# Altium schematic sheet MCU.SchDoc: MCU
size A3; Revision: V2.0; SheetNumber: 3; SheetTotal: 7; Project: PY32F403v1xT_START
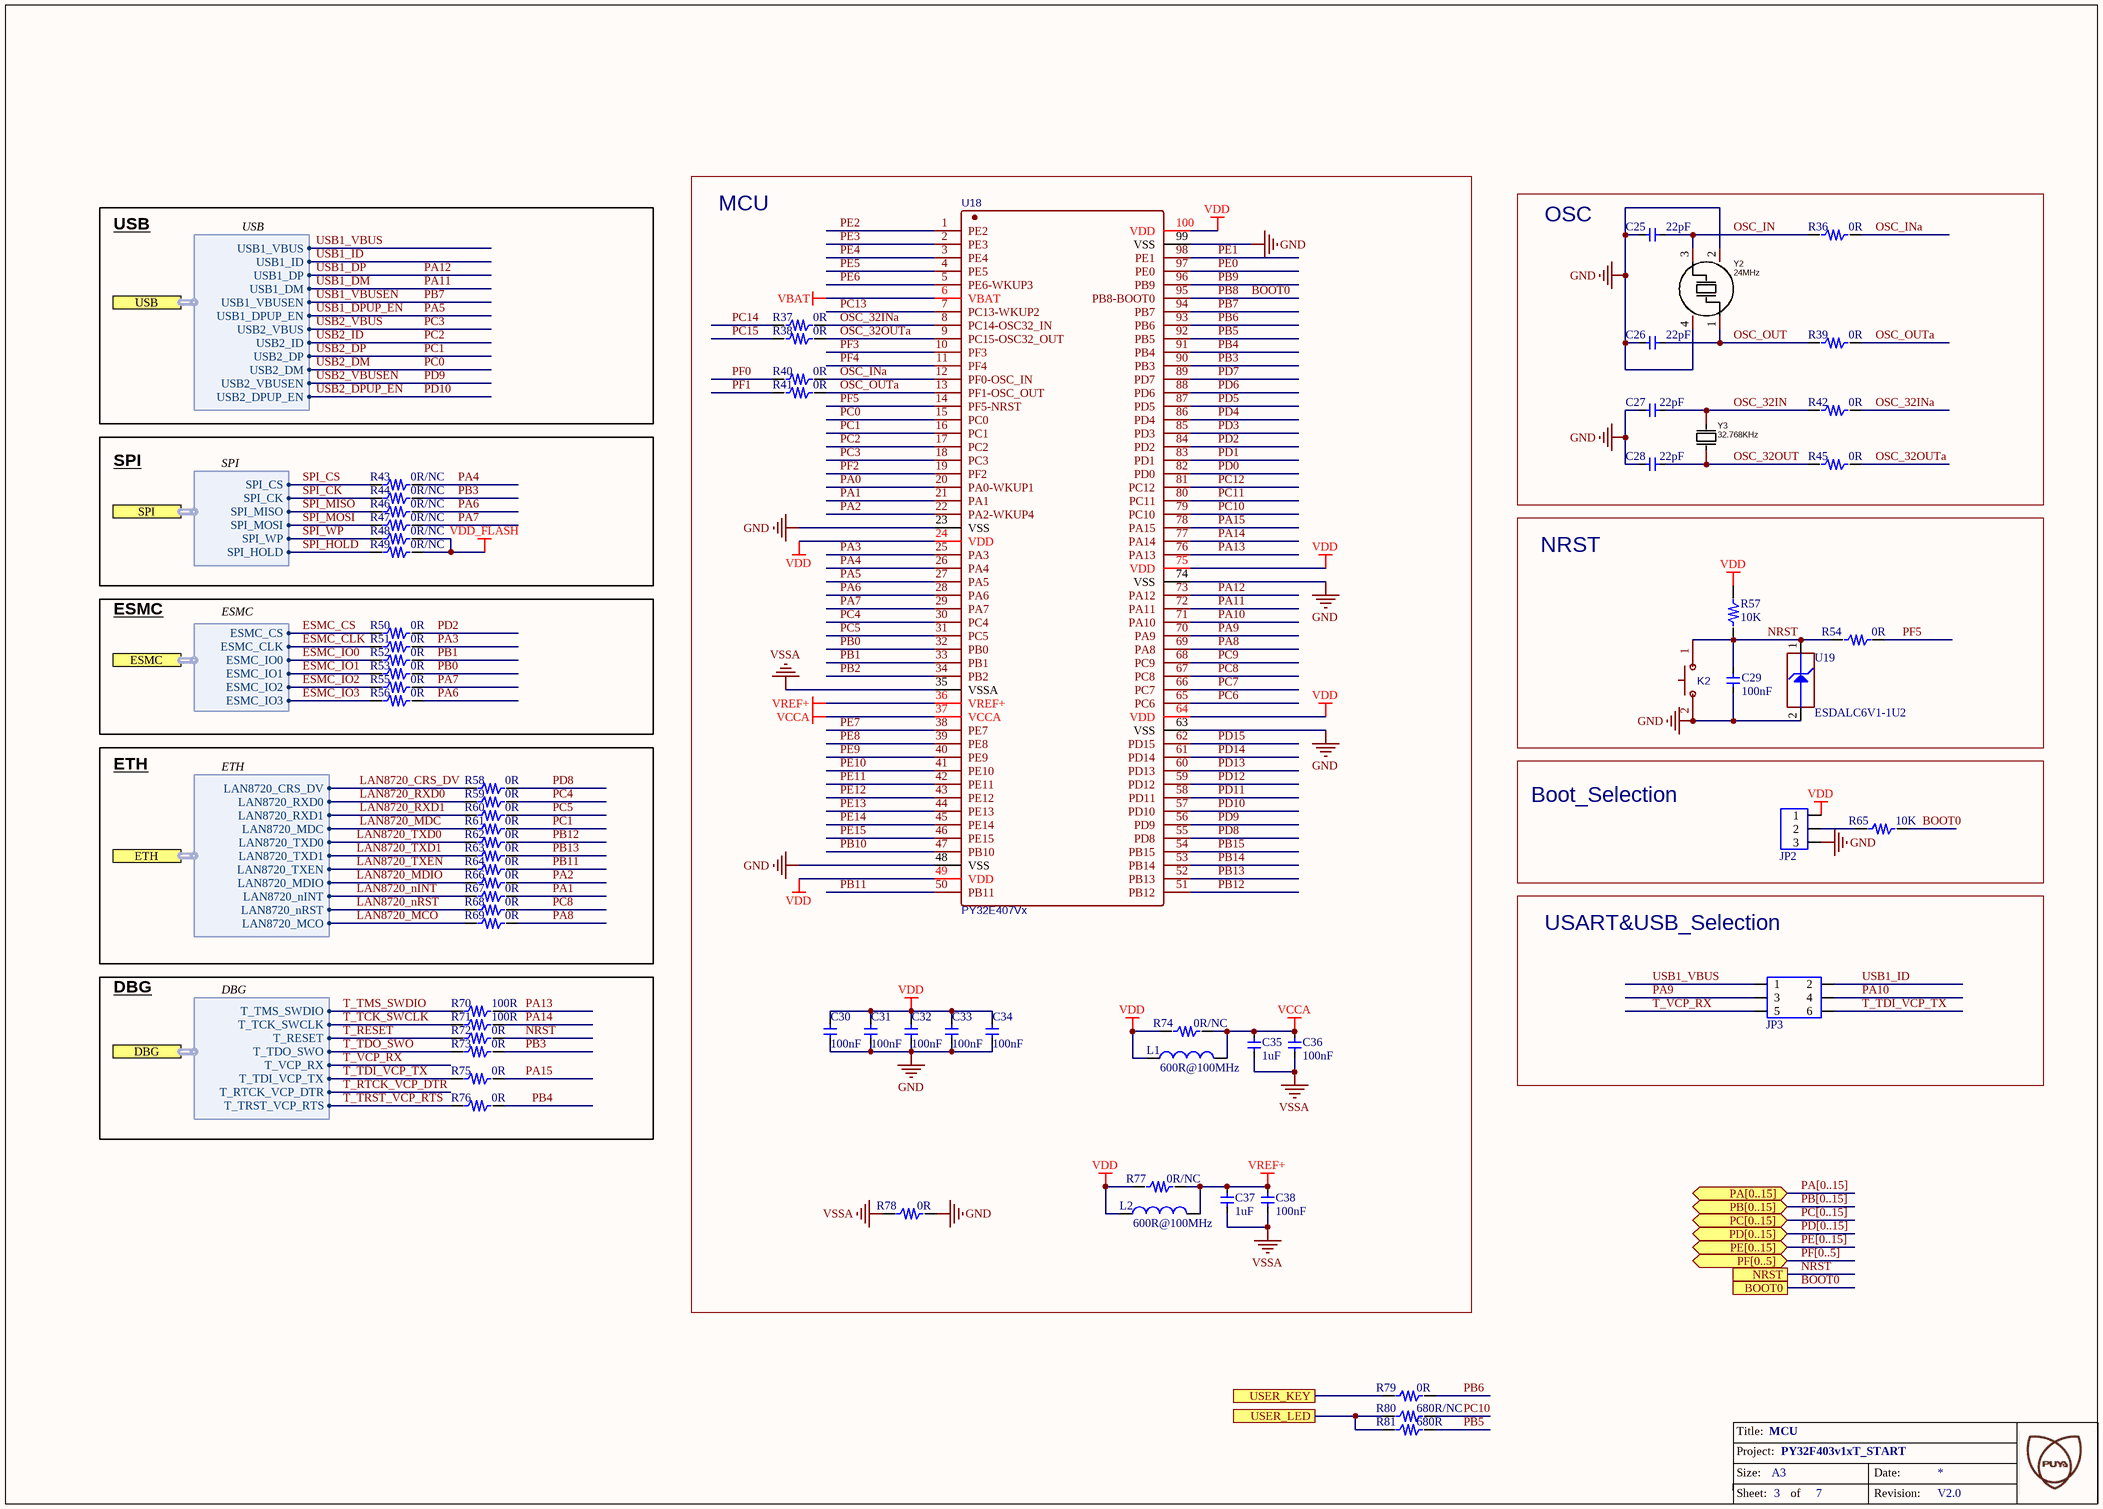
[diagram p0: MCU.SchDoc]

## Parts
C25  22pF  [C0603]
C26  22pF  [C0603]
C27  22pF  [C0603]
C28  22pF  [C0603]
C29  100nF  [C0603]
C30  100nF  [C0603]
C31  100nF  [C0603]
C32  100nF  [C0603]
C33  100nF  [C0603]
C34  100nF  [C0603]
C35  1uF  [C0805]
C36  100nF  [C0603]
C37  1uF  [C0805]
C38  100nF  [C0603]
JP2  CON3  [CON3]  (value not drawn)
JP3  CON3x2  [CON3x2]  (value not drawn)
K2  1TS002B-2600-5001_key  [Switch]  (value not drawn)
L1  value 600R@100MHz  [L0603]  (hidden comment: BEAD)
L2  value 600R@100MHz  [L0603]  (hidden comment: BEAD)
R36  0R  [R0603]
R37  0R  [R0603]
R38  0R  [R0603]
R39  0R  [R0603]
R40  0R  [R0603]
R41  0R  [R0603]
R42  0R  [R0603]
R43  0R/NC  [R0603]
R44  0R/NC  [R0603]
R45  0R  [R0603]
R46  0R/NC  [R0603]
R47  0R/NC  [R0603]
R48  0R/NC  [R0603]
R49  0R/NC  [R0603]
R50  0R  [R0603]
R51  0R  [R0603]
R52  0R  [R0603]
R53  0R  [R0603]
R54  0R  [R0603]
R55  0R  [R0603]
R56  0R  [R0603]
R57  10K  [R0603]
R58  0R  [R0603]
R59  0R  [R0603]
R60  0R  [R0603]
R61  0R  [R0603]
R62  0R  [R0603]
R63  0R  [R0603]
R64  0R  [R0603]
R65  10K  [R0603]
R66  0R  [R0603]
R67  0R  [R0603]
R68  0R  [R0603]
R69  0R  [R0603]
R70  100R  [R0603]
R71  100R  [R0603]
R72  0R  [R0603]
R73  0R  [R0603]
R74  0R/NC  [R0603]
R75  0R  [R0603]
R76  0R  [R0603]
R77  0R/NC  [R0603]
R78  0R  [R0603]
R79  0R  [R0603]
R80  680R/NC  [R0603]
R81  680R  [R0603]
U18  PY32E407Vx  [LQFP-100_L14.0-W14.0-P0.50-LS16.0-BL]
U19  value ESDALC6V1-1U2  [ESD_ST0201]  (hidden comment: ESD-TRANSIL)
Y2  24MHz  [CRYSTAL-SMD_4P-L3.2-W2.5-BL]
Y3  32.768KHz  [CRYSTAL-SMD_L3.2-W1.5-1]

## Blocks framed on the sheet
MCU: C30-C38 L1 L2 R37 R38 R40 R41 R74 R77 R78 U18
OSC: C25-C28 R36 R39 R42 R45 Y2 Y3
SPI: R43 R44 R46-R49
NRST: C29 K2 R54 R57 U19
ESMC: R50-R53 R55 R56
ETH: R58-R64 R66-R69
Boot_Selection: JP2 R65
USART&USB_Selection: JP3
DBG: R70-R73 R75 R76

## Ports
BOOT0, DBG (harness DBG), ESMC (harness ESMC), ETH (harness ETH), NRST, PA[0..15] (bidir), PB[0..15] (bidir), PC[0..15] (bidir), PD[0..15] (bidir), PE[0..15] (bidir), PF[0..5] (bidir), SPI (harness SPI), USB (harness USB), USER_KEY, USER_LED

## Harnesses
ETH: LAN8720_TXD0, LAN8720_MDC, LAN8720_RXD1, LAN8720_CRS_DV, LAN8720_TXD1, LAN8720_TXEN, LAN8720_nINT, LAN8720_MDIO, LAN8720_nRST, LAN8720_RXD0, LAN8720_MCO
ESMC: ESMC_IO2, ESMC_IO1, ESMC_IO0, ESMC_CS, ESMC_IO3, ESMC_CLK
DBG: T_VCP_RX, T_TDO_SWO, T_RESET, T_TMS_SWDIO, T_TDI_VCP_TX, T_TCK_SWCLK, T_RTCK_VCP_DTR, T_TRST_VCP_RTS
USB: USB2_VBUS, USB1_DM, USB1_DP, USB1_VBUS, USB2_ID, USB2_DP, USB2_DM, USB1_ID, USB2_VBUSEN, USB1_VBUSEN, USB1_DPUP_EN, USB2_DPUP_EN
SPI: SPI_MOSI, SPI_MISO, SPI_CS, SPI_CK, SPI_WP, SPI_HOLD

## Nets
GND: C25.1 C26.1 C27.1 C28.1 C29.1 C30.1 C31.1 C32.1 C33.1 C34.1 JP2.3 K2.2(B) R78.2 U18.23(VSS) U18.48(VSS) U18.63(VSS) U18.74(VSS) U18.99(VSS) U19.2(GND) Y2.2(GND) Y2.4(GND)
VBAT: U18.6(VBAT)
VCCA: C35.2 C36.2 L1.2 R74.2 U18.37(VCCA)
VDD: C30.2 C31.2 C32.2 C33.2 C34.2 JP2.1 L1.1 L2.1 R57.1 R74.1 R77.1 U18.24(VDD) U18.49(VDD) U18.64(VDD) U18.75(VDD) U18.100(VDD)
VDD_FLASH: R48.2 R49.2
VREF+: C37.2 C38.2 L2.2 R77.2 U18.36(VREF+)
VSSA: C35.1 C36.1 C37.1 C38.1 R78.1 U18.35(VSSA)
BOOT0: R65.2 U18.95(PB8-BOOT0) ; port BOOT0  [also labelled PB8]
ESMC_CLK: R51.1 ; port ESMC.ESMC_CLK
ESMC_CS: R50.1 ; port ESMC.ESMC_CS
ESMC_IO0: R52.1 ; port ESMC.ESMC_IO0
ESMC_IO1: R53.1 ; port ESMC.ESMC_IO1
ESMC_IO2: R55.1 ; port ESMC.ESMC_IO2
ESMC_IO3: R56.1 ; port ESMC.ESMC_IO3
LAN8720_CRS_DV: R58.1 ; port ETH.LAN8720_CRS_DV
LAN8720_MCO: R69.1 ; port ETH.LAN8720_MCO
LAN8720_MDC: R61.1 ; port ETH.LAN8720_MDC
LAN8720_MDIO: R66.1 ; port ETH.LAN8720_MDIO
LAN8720_nINT: R67.1 ; port ETH.LAN8720_nINT
LAN8720_nRST: R68.1 ; port ETH.LAN8720_nRST
LAN8720_RXD0: R59.1 ; port ETH.LAN8720_RXD0
LAN8720_RXD1: R60.1 ; port ETH.LAN8720_RXD1
LAN8720_TXD0: R62.1 ; port ETH.LAN8720_TXD0
LAN8720_TXD1: R63.1 ; port ETH.LAN8720_TXD1
LAN8720_TXEN: R64.1 ; port ETH.LAN8720_TXEN
NRST: C29.2 K2.1(A) R54.1 R57.2 R72.2 U19.1(IO1) ; port NRST
OSC_32IN: C27.2 R42.1 Y3.2(OSC2)
OSC_32INa: R37.2 R42.2 U18.8(PC14-OSC32_IN)
OSC_32OUT: C28.2 R45.1 Y3.1(OSC1)
OSC_32OUTa: R38.2 R45.2 U18.9(PC15-OSC32_OUT)
OSC_IN: C25.2 R36.1 Y2.3(OSC2)
OSC_INa: R36.2 R40.2 U18.12(PF0-OSC_IN)
OSC_OUT: C26.2 R39.1 Y2.1(OSC1)
OSC_OUTa: R39.2 R41.2 U18.13(PF1-OSC_OUT)
PA0: U18.20(PA0-WKUP1)
PA1: R67.2 U18.21(PA1)
PA2: R66.2 U18.22(PA2-WKUP4)
PA3: R51.2 U18.25(PA3)
PA4: R43.2 U18.26(PA4)
PA5: U18.27(PA5) ; port USB.USB1_DPUP_EN  [also labelled USB1_DPUP_EN]
PA6: R46.2 R56.2 U18.28(PA6)
PA7: R47.2 R55.2 U18.29(PA7)
PA8: R69.2 U18.69(PA8)
PA9: JP3.3 U18.70(PA9)
PA10: JP3.4 U18.71(PA10)
PA11: U18.72(PA11) ; port USB.USB1_DM  [also labelled USB1_DM]
PA12: U18.73(PA12) ; port USB.USB1_DP  [also labelled USB1_DP]
PA13: R70.2 U18.76(PA13)
PA14: R71.2 U18.77(PA14)
PA15: R75.2 U18.78(PA15)
PB0: R53.2 U18.32(PB0)
PB1: R52.2 U18.33(PB1)
PB2: U18.34(PB2)
PB3: R44.2 R73.2 U18.90(PB3)
PB4: R76.2 U18.91(PB4)
PB5: R81.2 U18.92(PB5)
PB6: R79.2 U18.93(PB6)
PB7: U18.94(PB7) ; port USB.USB1_VBUSEN  [also labelled USB1_VBUSEN]
PB9: U18.96(PB9)
PB10: U18.47(PB10)
PB11: R64.2 U18.50(PB11)
PB12: R62.2 U18.51(PB12)
PB13: R63.2 U18.52(PB13)
PB14: U18.53(PB14)
PB15: U18.54(PB15)
PC0: U18.15(PC0) ; port USB.USB2_DM  [also labelled USB2_DM]
PC1: R61.2 U18.16(PC1) ; port USB.USB2_DP  [also labelled USB2_DP]
PC2: U18.17(PC2) ; port USB.USB2_ID  [also labelled USB2_ID]
PC3: U18.18(PC3) ; port USB.USB2_VBUS  [also labelled USB2_VBUS]
PC4: R59.2 U18.30(PC4)
PC5: R60.2 U18.31(PC5)
PC6: U18.65(PC6)
PC7: U18.66(PC7)
PC8: R68.2 U18.67(PC8)
PC9: U18.68(PC9)
PC10: R80.2 U18.79(PC10)
PC11: U18.80(PC11)
PC12: U18.81(PC12)
PC13: U18.7(PC13-WKUP2)
PC14: R37.1
PC15: R38.1
PD0: U18.82(PD0)
PD1: U18.83(PD1)
PD2: R50.2 U18.84(PD2)
PD3: U18.85(PD3)
PD4: U18.86(PD4)
PD5: U18.87(PD5)
PD6: U18.88(PD6)
PD7: U18.89(PD7)
PD8: R58.2 U18.55(PD8)
PD9: U18.56(PD9) ; port USB.USB2_VBUSEN  [also labelled USB2_VBUSEN]
PD10: U18.57(PD10) ; port USB.USB2_DPUP_EN  [also labelled USB2_DPUP_EN]
PD11: U18.58(PD11)
PD12: U18.59(PD12)
PD13: U18.60(PD13)
PD14: U18.61(PD14)
PD15: U18.62(PD15)
PE0: U18.97(PE0)
PE1: U18.98(PE1)
PE2: U18.1(PE2)
PE3: U18.2(PE3)
PE4: U18.3(PE4)
PE5: U18.4(PE5)
PE6: U18.5(PE6-WKUP3)
PE7: U18.38(PE7)
PE8: U18.39(PE8)
PE9: U18.40(PE9)
PE10: U18.41(PE10)
PE11: U18.42(PE11)
PE12: U18.43(PE12)
PE13: U18.44(PE13)
PE14: U18.45(PE14)
PE15: U18.46(PE15)
PF0: R40.1
PF1: R41.1
PF2: U18.19(PF2)
PF3: U18.10(PF3)
PF4: U18.11(PF4)
PF5: R54.2 U18.14(PF5-NRST)
SPI_CK: R44.1 ; port SPI.SPI_CK
SPI_CS: R43.1 ; port SPI.SPI_CS
SPI_HOLD: R49.1 ; port SPI.SPI_HOLD
SPI_MISO: R46.1 ; port SPI.SPI_MISO
SPI_MOSI: R47.1 ; port SPI.SPI_MOSI
SPI_WP: R48.1 ; port SPI.SPI_WP
T_RESET: R72.1 ; port DBG.T_RESET
T_RTCK_VCP_DTR: port DBG.T_RTCK_VCP_DTR
T_TCK_SWCLK: R71.1 ; port DBG.T_TCK_SWCLK
T_TDI_VCP_TX: JP3.6 R75.1 ; port DBG.T_TDI_VCP_TX
T_TDO_SWO: R73.1 ; port DBG.T_TDO_SWO
T_TMS_SWDIO: R70.1
T_TRST_VCP_RTS: R76.1 ; port DBG.T_TRST_VCP_RTS
T_VCP_RX: JP3.5 ; port DBG.T_VCP_RX
USB1_ID: JP3.2 ; port USB.USB1_ID
USB1_VBUS: JP3.1 ; port USB.USB1_VBUS
USER_KEY: R79.1 ; port USER_KEY
USER_LED: R80.1 R81.1 ; port USER_LED
NetJP2_2: JP2.2 R65.1

## Buses and harness runs
bus PA[0..15] = port PA[0..15]
bus PB[0..15] = port PB[0..15]
bus PC[0..15] = port PC[0..15]
bus PD[0..15] = port PD[0..15]
bus PE[0..15] = port PE[0..15]
bus PF[0..5] = port PF[0..5]

## Notes on the sheet
- USB
- Title:
- Project:
- Size:
- Sheet:
- A3
- of
- Date:
- Revision:

## Library data of the parts
C25-C34 C36 C38 = C0603: PCB DECAL: 0603
C35 C37 = C0805: PCB DECAL: 0805
JP3 = CON3x2: PCB DECAL: CON5x2
K2 = 1TS002B-2600-5001_key: BOM_Manufacturer: HYP; Contributor: LCSC; BOM_Supplier: LCSC; BOM_Supplier Part: C319334; BOM_Manufacturer Part: 1TS002B-2600-5001_KEY; BOM_JLCPCB Part Class: Extended Part; spicePre: S; spiceSymbolName: 1TS002B-2600-5001
L1 L2 = BEAD: SMD Chip ferrite bead, 600R@100MHz +/-25%, 350mA, 500mohm DC, 0603, T=0.8mm; Internal_Part_Number: MCD-00047; Part_Type: Inductor; Manufacturer_Part_Number: FCM1608KF-601T03; Manufacturer: TAI-TECH; Provided_By: SUBCO; Status: Released; ComponentLink1Description: Datasheet; ComponentLink1URL: http://tunmcdsvn.tun.st.com/Component_Datasheet_Library/Trunk/Inductors/TaiTech_Bead_FCM1608_series; ECCN_US: n/a; ECCN_EU: n/a
R36-R81 = R0603: PCB DECAL: 0603
U18 = PY32E407Vx: LQFP100; BOM_Manufacturer: PUYA(普冉); BOM_Manufacturer Part: PY32E407Vx; spicePre: U; spiceSymbolName: PY32E407Vx
U19 = ESD-TRANSIL: ESD protection 6V1; Internal_Part_Number: MCD-00170; Part_Type: Diode; Manufacturer: STMICROELECTRONICS; ECCN_US: EAR99; ECCN_EU: NEC; Provided_By: Subcon; Initial_Board_Reference: MB1274; Status: Released; Manufacturer_Part_Number: ESDALC6V1-1U2; ComponentLink1Description: STM_ESD_ESDALC6V1-1U2.pdf; ComponentLink1URL: http://tunmcdsvn.tun.st.com/Component_Datasheet_Library/Trunk/Diodes/STM_ESD_ESDALC6V1-1U2
Y2 = ABM8AIG-24.000MHZ-82Z-T: ±20ppm , 12.5pF , T_use: -40°C~85°C  C2682775; Manufacturer: ABRACON; Add into BOM: yes; External load capacitor: 8pF; Frequency Stability(Full temperature range): ±50ppm; Equivalent Series Resistance (ESR): 50Ω; Name: 24MHz; Symbol: ABM8AIG-24.000MHZ-82Z-T; Device: ABM8AIG-24.000MHZ-82Z-T; LCSC Part Name: 24MHz ±20ppm 8pF; Supplier Part: C1669761; Manufacturer Part: ABM8AIG-24.000MHZ-82Z-T; Supplier Footprint: SMD3225-4P; JLCPCB Part Class: Extended Part; Datasheet: https://atta.szlcsc.com/upload/public/pdf/source/20210326/C1986479_1F0B0D93791ADB7A90489BA856D17A98.pdf; Supplier: LCSC; Convert to PCB: yes; Value: 24MHz; Normal temperature Frequency Tolerance: ±20ppm; Operating Temperature: -40℃~+125℃
Y3 = XKXGI-SUA-32.768K: ±20ppm , 12.5pF , T_use: -40°C~125°C; Manufacturer: YXC(扬兴晶振); Add into BOM: yes; Crystal Type: 贴片晶振; Frequency Stability(Full temperature range): ±30ppm; Name: 32.768kHz; Symbol: XKXGI-SUA-32.768K; Device: XKXGI-SUA-32.768K; LCSC Part Name: 32.768kHz ±20ppm 12.5pF YST310S; Supplier Part: C5213671; Manufacturer Part: XKXGI-SUA-32.768K; Supplier Footprint: SMD3215-2P; JLCPCB Part Class: Extended Part; Datasheet: https://atta.szlcsc.com/upload/public/pdf/source/20240329/3A7650FD985DD0DE85694D3785AB4916.pdf; Supplier: LCSC; Convert to PCB: yes; Value: 32.768kHz; Normal temperature Frequency Tolerance: ±20ppm; External load capacitor: 12.5pF; Operating Temperature: -40℃~+85℃